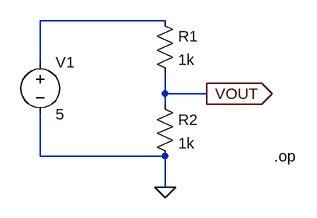
[diagram p0: schematic W01_D01_VoltageDivider.asc]
W01_D01_VoltageDivider.asc, the LTspice schematic file:
Version 4.1
SHEET 1 880 680
WIRE 80 64 -112 64
WIRE -112 128 -112 64
WIRE 80 176 80 144
WIRE 144 176 80 176
WIRE 80 192 80 176
WIRE -112 272 -112 208
WIRE 80 272 -112 272
WIRE 80 320 80 272
FLAG 80 320 0
FLAG 144 176 VOUT
IOPIN 144 176 Out
SYMBOL res 64 48 R0
SYMATTR InstName R1
SYMATTR Value 1k
SYMBOL res 64 176 R0
SYMATTR InstName R2
SYMATTR Value 1k
SYMBOL voltage -112 112 R0
WINDOW 123 0 0 Left 0
WINDOW 39 0 0 Left 0
SYMATTR InstName V1
SYMATTR Value 5
TEXT 248 272 Left 2 !.op

The netlist it stands for:
* W01_D01_VoltageDivider.asc
R1 N001 VOUT 1k
R2 VOUT 0 1k
V1 N001 0 5
.op
.backanno
.end